# Altium schematic sheet 17_Radar_service_USB_and_boot.SchDoc
size 289 x 400 mm
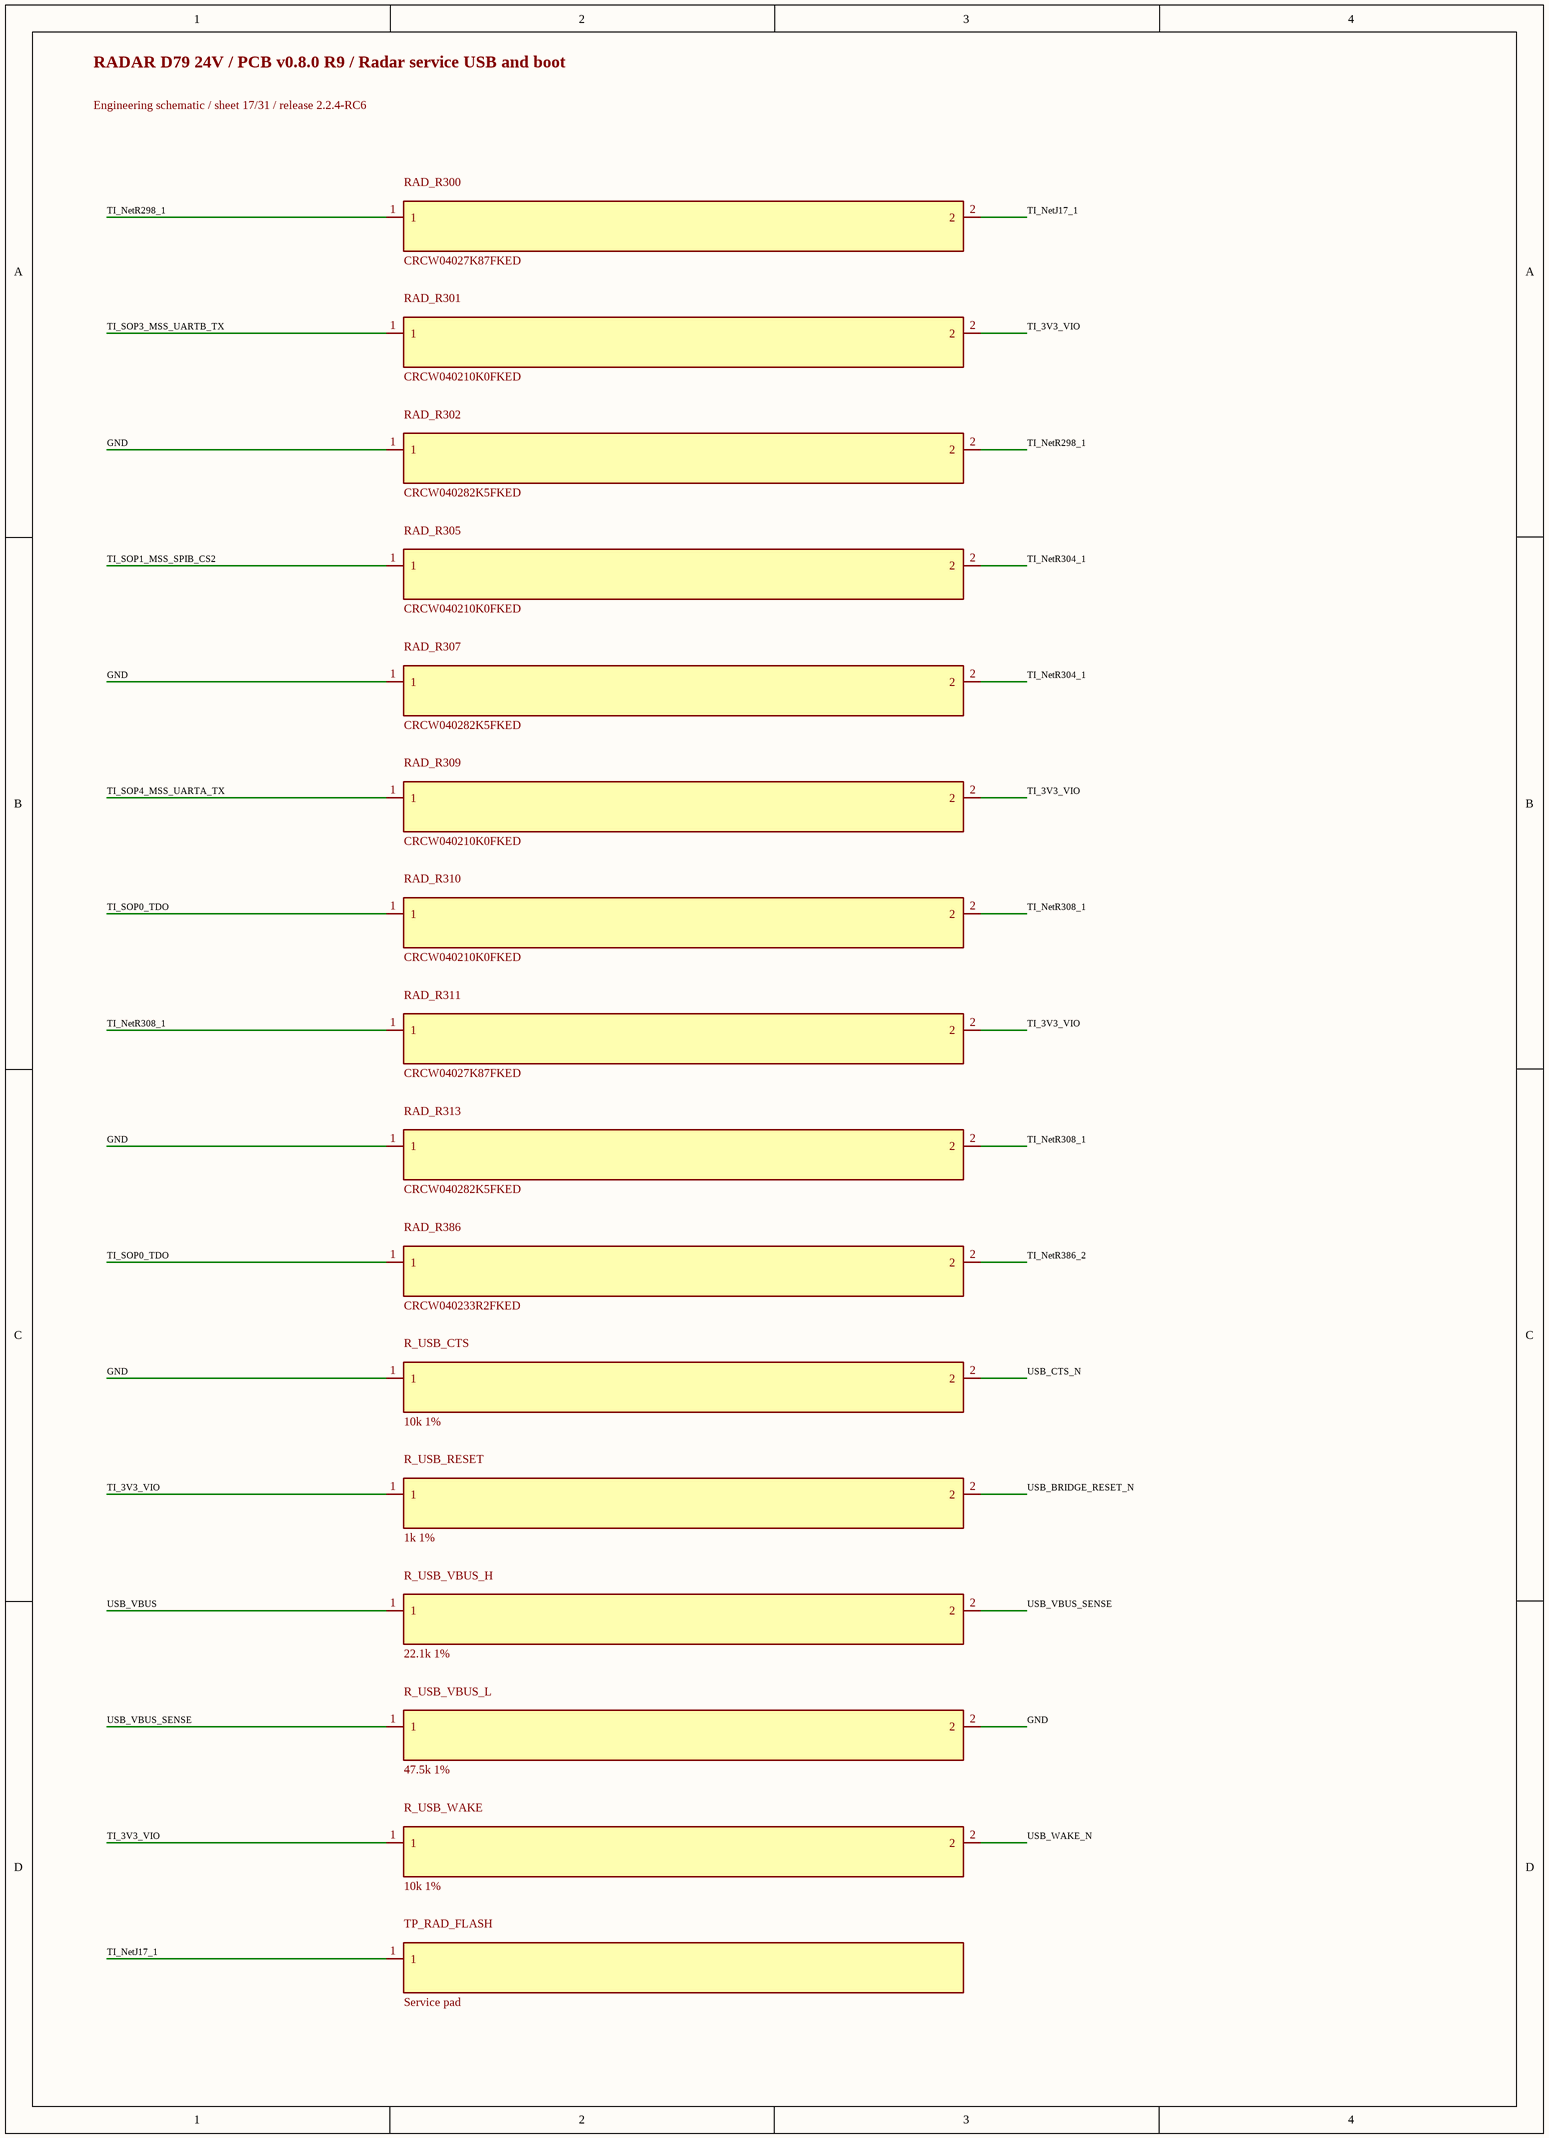
[diagram p0: 17_Radar_service_USB_and_boot.SchDoc]

## Parts
R_USB_CTS  10k 1%  [R_0402_1005Metric]
R_USB_RESET  1k 1%  [R_0402_1005Metric]
R_USB_VBUS_H  22.1k 1%  [R_0402_1005Metric]
R_USB_VBUS_L  47.5k 1%  [R_0402_1005Metric]
R_USB_WAKE  10k 1%  [R_0402_1005Metric]
RAD_R300  CRCW04027K87FKED  [0402L]
RAD_R301  CRCW040210K0FKED  [0402L]
RAD_R302  CRCW040282K5FKED  [0402L]
RAD_R305  CRCW040210K0FKED  [0402L]
RAD_R307  CRCW040282K5FKED  [0402L]
RAD_R309  CRCW040210K0FKED  [0402L]
RAD_R310  CRCW040210K0FKED  [0402L]
RAD_R311  CRCW04027K87FKED  [0402L]
RAD_R313  CRCW040282K5FKED  [0402L]
RAD_R386  CRCW040233R2FKED  [0402L]
TP_RAD_FLASH  Service pad  [TestPoint_Pad_D1.5mm]

## Nets
GND: R_USB_CTS.1 R_USB_VBUS_L.2 RAD_R302.1 RAD_R307.1 RAD_R313.1
TI_3V3_VIO: R_USB_RESET.1 R_USB_WAKE.1 RAD_R301.2 RAD_R309.2 RAD_R311.2
TI_NetJ17_1: RAD_R300.2 TP_RAD_FLASH.1
TI_NetR298_1: RAD_R300.1 RAD_R302.2
TI_NetR304_1: RAD_R305.2 RAD_R307.2
TI_NetR308_1: RAD_R310.2 RAD_R311.1 RAD_R313.2
TI_NetR386_2: RAD_R386.2
TI_SOP0_TDO: RAD_R310.1 RAD_R386.1
TI_SOP1_MSS_SPIB_CS2: RAD_R305.1
TI_SOP3_MSS_UARTB_TX: RAD_R301.1
TI_SOP4_MSS_UARTA_TX: RAD_R309.1
USB_BRIDGE_RESET_N: R_USB_RESET.2
USB_CTS_N: R_USB_CTS.2
USB_VBUS: R_USB_VBUS_H.1
USB_VBUS_SENSE: R_USB_VBUS_H.2 R_USB_VBUS_L.1
USB_WAKE_N: R_USB_WAKE.2

## Notes on the sheet
- RADAR D79 24V / PCB v0.8.0 R9 / Radar service USB and boot
- Engineering schematic / sheet 17/31 / release 2.2.4-RC6